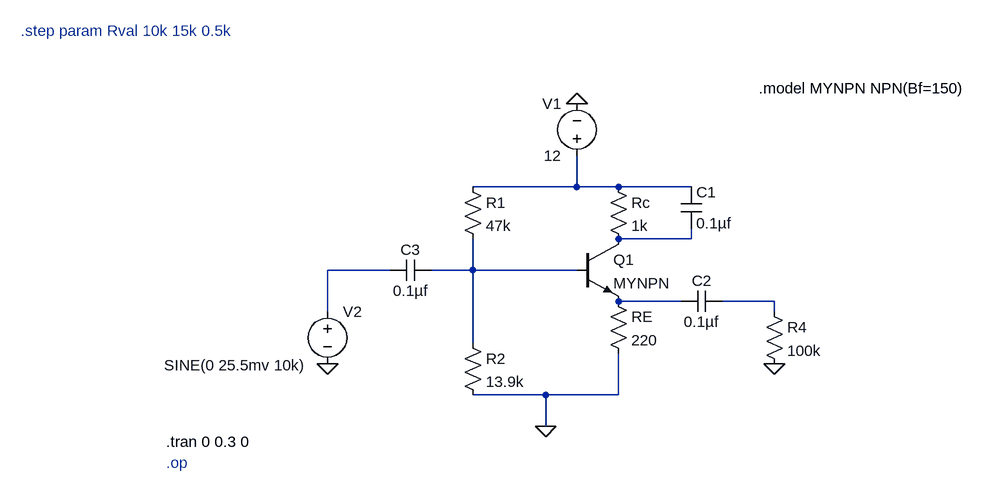
[diagram p0: schematic exp3.asc]
exp3.asc, the LTspice schematic file:
Version 4.1
SHEET 1 940 680
WIRE 224 128 224 80
WIRE 224 128 64 128
WIRE 288 128 224 128
WIRE 400 128 288 128
WIRE 400 208 400 192
WIRE 400 208 288 208
WIRE -64 256 -160 256
WIRE 64 256 64 208
WIRE 64 256 0 256
WIRE 224 256 64 256
WIRE 384 304 288 304
WIRE 528 304 448 304
WIRE -160 320 -160 256
WIRE 528 320 528 304
WIRE 64 368 64 256
WIRE 176 448 64 448
WIRE 288 448 288 384
WIRE 288 448 176 448
WIRE 176 496 176 448
FLAG 224 0 0
FLAG 528 400 0
FLAG -160 400 0
FLAG 176 496 0
DATAFLAG 64 256 ""
DATAFLAG 288 208 ""
DATAFLAG 304 304 ""
SYMBOL cap 384 128 R0
SYMATTR InstName C1
SYMATTR Value 0.1µf
SYMBOL res 272 112 R0
SYMATTR InstName Rc
SYMATTR Value 1k
SYMBOL res 48 112 R0
SYMATTR InstName R1
SYMATTR Value 47k
SYMBOL npn 224 208 R0
SYMATTR InstName Q1
SYMATTR Value MYNPN
SYMBOL voltage 224 96 R180
WINDOW 0 24 96 Left 2
WINDOW 3 24 16 Left 2
WINDOW 123 0 0 Left 0
WINDOW 39 0 0 Left 0
SYMATTR InstName V1
SYMATTR Value 12
SYMBOL res 272 288 R0
SYMATTR InstName RE
SYMATTR Value 220
SYMBOL cap 448 288 R90
WINDOW 0 0 32 VBottom 2
WINDOW 3 32 32 VTop 2
SYMATTR InstName C2
SYMATTR Value 0.1µf
SYMBOL res 512 304 R0
SYMATTR InstName R4
SYMATTR Value 100k
SYMBOL cap 0 240 R90
WINDOW 0 0 32 VBottom 2
WINDOW 3 32 32 VTop 2
SYMATTR InstName C3
SYMATTR Value 0.1µf
SYMBOL voltage -160 304 R0
WINDOW 3 -251 98 Left 2
WINDOW 123 0 0 Left 0
WINDOW 39 0 0 Left 0
SYMATTR Value SINE(0 25.5mv 10k)
SYMATTR InstName V2
SYMBOL res 48 352 R0
SYMATTR InstName R2
SYMATTR Value 13.9k
TEXT 504 -24 Left 2 !.model MYNPN NPN(Bf=150)
TEXT -408 520 Left 2 !.tran 0 0.3 0
TEXT -408 552 Left 2 ;.op
TEXT -632 -112 Left 2 ;.step param Rval 10k 15k 0.5k

The netlist it stands for:
* exp3.asc
C1 N001 N002 0.1µf
Rc N001 N002 1k
R1 N001 N004 47k
Q1 N002 N004 N005 0 MYNPN
V1 N001 0 12
RE N005 0 220
C2 N006 N005 0.1µf
R4 N006 0 100k
C3 N004 N003 0.1µf
V2 N003 0 SINE(0 25.5mv 10k)
R2 N004 0 13.9k
.model NPN NPN
.model PNP PNP
.lib standard.bjt
.model MYNPN NPN(Bf=150)
.tran 0 0.3 0
* .op
* .step param Rval 10k 15k 0.5k
.backanno
.end